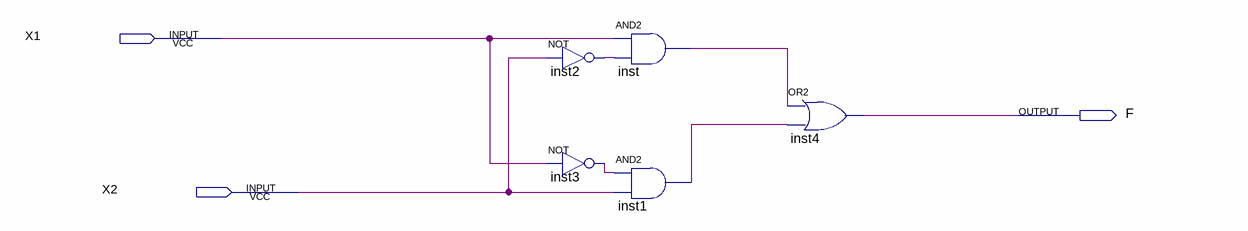
[diagram p0: schematic sheet]
// Quartus schematic comb_logic_old.bdf as structural Verilog: 5 symbols, 3 pins
module comb_logic_old (
  input  X1,
  input  X2,
  output F
);

  wire inst1_out, inst2_out, inst3_out, inst_out;

  not inst2 (inst2_out, X2);
  not inst3 (inst3_out, X1);
  and inst (inst_out, X1, inst2_out);
  and inst1 (inst1_out, inst3_out, X2);
  or inst4 (F, inst_out, inst1_out);
endmodule
